# Altium project DT10965_MOTOR_CONTROLLER.PrjPcb (part 2 of 6)

## Sheet Flash_memory.SchDoc: =DT_SCH_Title
size A3; Organization: Droid Technologies; DocumentNumber: DT10965; Revision: 1.0; SheetNumber: 5; SheetTotal: 18
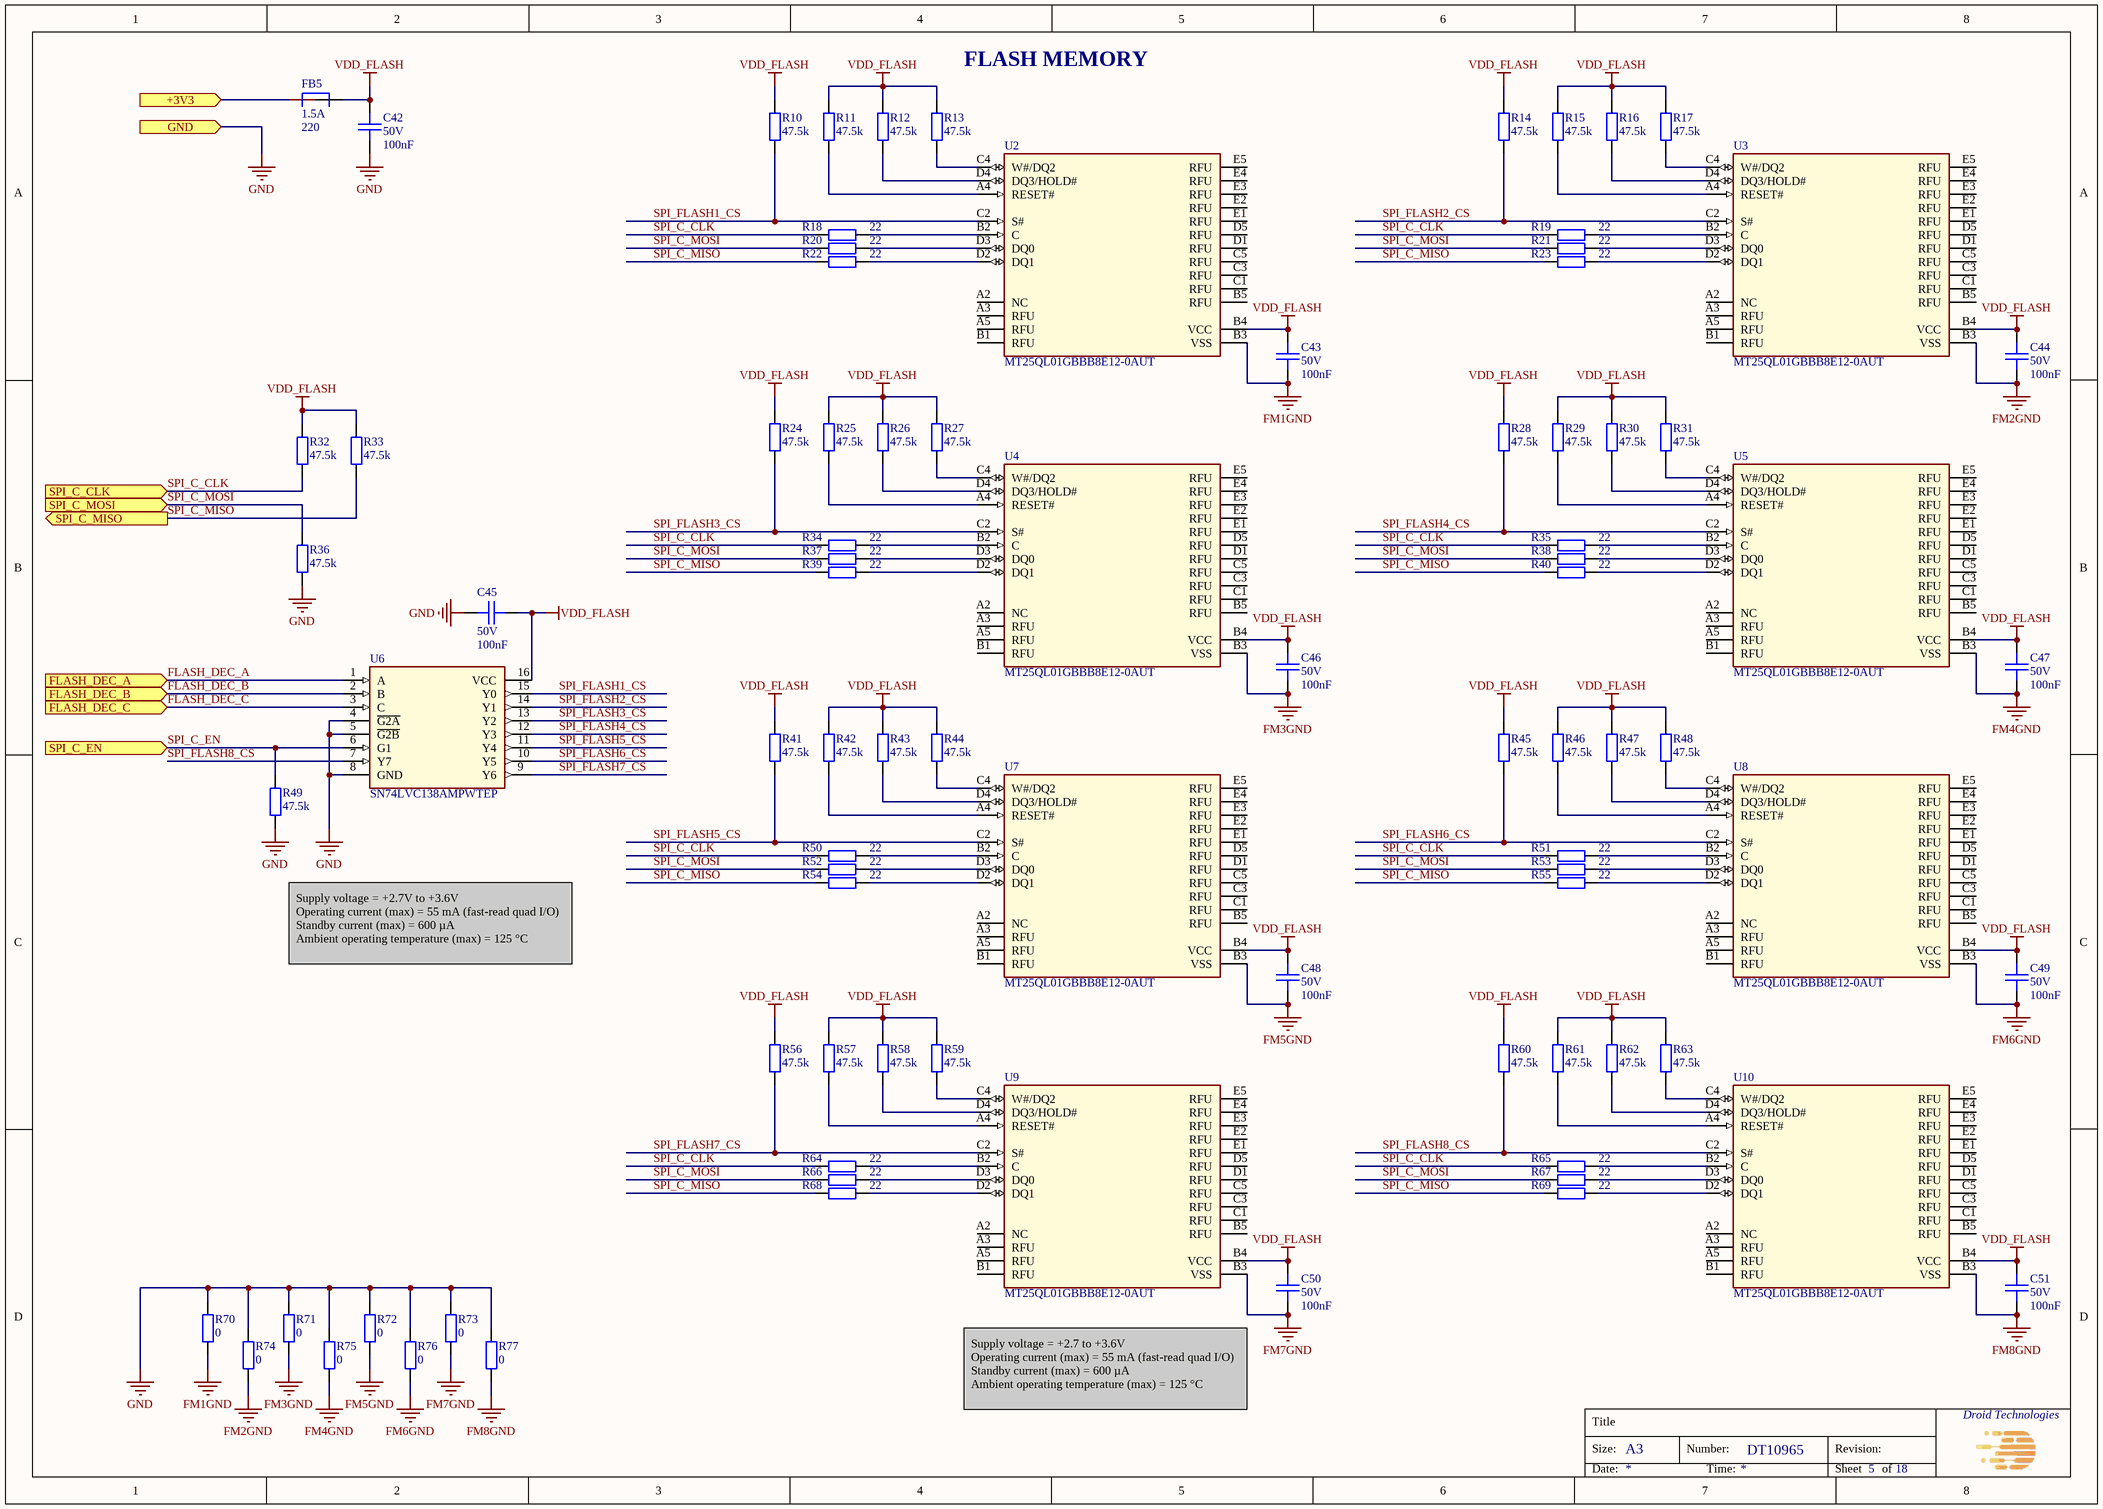
[diagram p4: Flash_memory.SchDoc]

### Parts
C42  Voltage Rating: 50V  Capacitance: 100nF  [CAPC100x50x50L25]  (hidden comment: GCM155L8EH104KE07D)
C43  Voltage Rating: 50V  Capacitance: 100nF  [CAPC100x50x50L25]  (hidden comment: GCM155L8EH104KE07D)
C44  Voltage Rating: 50V  Capacitance: 100nF  [CAPC100x50x50L25]  (hidden comment: GCM155L8EH104KE07D)
C45  Voltage Rating: 50V  Capacitance: 100nF  [CAPC100x50x50L25]  (hidden comment: GCM155L8EH104KE07D)
C46  Voltage Rating: 50V  Capacitance: 100nF  [CAPC100x50x50L25]  (hidden comment: GCM155L8EH104KE07D)
C47  Voltage Rating: 50V  Capacitance: 100nF  [CAPC100x50x50L25]  (hidden comment: GCM155L8EH104KE07D)
C48  Voltage Rating: 50V  Capacitance: 100nF  [CAPC100x50x50L25]  (hidden comment: GCM155L8EH104KE07D)
C49  Voltage Rating: 50V  Capacitance: 100nF  [CAPC100x50x50L25]  (hidden comment: GCM155L8EH104KE07D)
C50  Voltage Rating: 50V  Capacitance: 100nF  [CAPC100x50x50L25]  (hidden comment: GCM155L8EH104KE07D)
C51  Voltage Rating: 50V  Capacitance: 100nF  [CAPC100x50x50L25]  (hidden comment: GCM155L8EH104KE07D)
FB5  Imax: 1.5A  Impedance: 220  [BEADC160X80X95L40]  (hidden comment: BLM18KG221BH1D)
R10  Resistance: 47.5k  [RESC100X50X40L25]  (hidden comment: RC0402FR-0747K5L)
R11  Resistance: 47.5k  [RESC100X50X40L25]  (hidden comment: RC0402FR-0747K5L)
R12  Resistance: 47.5k  [RESC100X50X40L25]  (hidden comment: RC0402FR-0747K5L)
R13  Resistance: 47.5k  [RESC100X50X40L25]  (hidden comment: RC0402FR-0747K5L)
R14  Resistance: 47.5k  [RESC100X50X40L25]  (hidden comment: RC0402FR-0747K5L)
R15  Resistance: 47.5k  [RESC100X50X40L25]  (hidden comment: RC0402FR-0747K5L)
R16  Resistance: 47.5k  [RESC100X50X40L25]  (hidden comment: RC0402FR-0747K5L)
R17  Resistance: 47.5k  [RESC100X50X40L25]  (hidden comment: RC0402FR-0747K5L)
R18  Resistance: 22  [RESC100X50X40L25]  (hidden comment: RC0402FR-0722RL)
R19  Resistance: 22  [RESC100X50X40L25]  (hidden comment: RC0402FR-0722RL)
R20  Resistance: 22  [RESC100X50X40L25]  (hidden comment: RC0402FR-0722RL)
R21  Resistance: 22  [RESC100X50X40L25]  (hidden comment: RC0402FR-0722RL)
R22  Resistance: 22  [RESC100X50X40L25]  (hidden comment: RC0402FR-0722RL)
R23  Resistance: 22  [RESC100X50X40L25]  (hidden comment: RC0402FR-0722RL)
R24  Resistance: 47.5k  [RESC100X50X40L25]  (hidden comment: RC0402FR-0747K5L)
R25  Resistance: 47.5k  [RESC100X50X40L25]  (hidden comment: RC0402FR-0747K5L)
R26  Resistance: 47.5k  [RESC100X50X40L25]  (hidden comment: RC0402FR-0747K5L)
R27  Resistance: 47.5k  [RESC100X50X40L25]  (hidden comment: RC0402FR-0747K5L)
R28  Resistance: 47.5k  [RESC100X50X40L25]  (hidden comment: RC0402FR-0747K5L)
R29  Resistance: 47.5k  [RESC100X50X40L25]  (hidden comment: RC0402FR-0747K5L)
R30  Resistance: 47.5k  [RESC100X50X40L25]  (hidden comment: RC0402FR-0747K5L)
R31  Resistance: 47.5k  [RESC100X50X40L25]  (hidden comment: RC0402FR-0747K5L)
R32  Resistance: 47.5k  [RESC100X50X40L25]  (hidden comment: RC0402FR-0747K5L)
R33  Resistance: 47.5k  [RESC100X50X40L25]  (hidden comment: RC0402FR-0747K5L)
R34  Resistance: 22  [RESC100X50X40L25]  (hidden comment: RC0402FR-0722RL)
R35  Resistance: 22  [RESC100X50X40L25]  (hidden comment: RC0402FR-0722RL)
R36  Resistance: 47.5k  [RESC100X50X40L25]  (hidden comment: RC0402FR-0747K5L)
R37  Resistance: 22  [RESC100X50X40L25]  (hidden comment: RC0402FR-0722RL)
R38  Resistance: 22  [RESC100X50X40L25]  (hidden comment: RC0402FR-0722RL)
R39  Resistance: 22  [RESC100X50X40L25]  (hidden comment: RC0402FR-0722RL)
R40  Resistance: 22  [RESC100X50X40L25]  (hidden comment: RC0402FR-0722RL)
R41  Resistance: 47.5k  [RESC100X50X40L25]  (hidden comment: RC0402FR-0747K5L)
R42  Resistance: 47.5k  [RESC100X50X40L25]  (hidden comment: RC0402FR-0747K5L)
R43  Resistance: 47.5k  [RESC100X50X40L25]  (hidden comment: RC0402FR-0747K5L)
R44  Resistance: 47.5k  [RESC100X50X40L25]  (hidden comment: RC0402FR-0747K5L)
R45  Resistance: 47.5k  [RESC100X50X40L25]  (hidden comment: RC0402FR-0747K5L)
R46  Resistance: 47.5k  [RESC100X50X40L25]  (hidden comment: RC0402FR-0747K5L)
R47  Resistance: 47.5k  [RESC100X50X40L25]  (hidden comment: RC0402FR-0747K5L)
R48  Resistance: 47.5k  [RESC100X50X40L25]  (hidden comment: RC0402FR-0747K5L)
R49  Resistance: 47.5k  [RESC100X50X40L25]  (hidden comment: RC0402FR-0747K5L)
R50  Resistance: 22  [RESC100X50X40L25]  (hidden comment: RC0402FR-0722RL)
R51  Resistance: 22  [RESC100X50X40L25]  (hidden comment: RC0402FR-0722RL)
R52  Resistance: 22  [RESC100X50X40L25]  (hidden comment: RC0402FR-0722RL)
R53  Resistance: 22  [RESC100X50X40L25]  (hidden comment: RC0402FR-0722RL)
R54  Resistance: 22  [RESC100X50X40L25]  (hidden comment: RC0402FR-0722RL)
R55  Resistance: 22  [RESC100X50X40L25]  (hidden comment: RC0402FR-0722RL)
R56  Resistance: 47.5k  [RESC100X50X40L25]  (hidden comment: RC0402FR-0747K5L)
R57  Resistance: 47.5k  [RESC100X50X40L25]  (hidden comment: RC0402FR-0747K5L)
R58  Resistance: 47.5k  [RESC100X50X40L25]  (hidden comment: RC0402FR-0747K5L)
R59  Resistance: 47.5k  [RESC100X50X40L25]  (hidden comment: RC0402FR-0747K5L)
R60  Resistance: 47.5k  [RESC100X50X40L25]  (hidden comment: RC0402FR-0747K5L)
R61  Resistance: 47.5k  [RESC100X50X40L25]  (hidden comment: RC0402FR-0747K5L)
R62  Resistance: 47.5k  [RESC100X50X40L25]  (hidden comment: RC0402FR-0747K5L)
R63  Resistance: 47.5k  [RESC100X50X40L25]  (hidden comment: RC0402FR-0747K5L)
R64  Resistance: 22  [RESC100X50X40L25]  (hidden comment: RC0402FR-0722RL)
R65  Resistance: 22  [RESC100X50X40L25]  (hidden comment: RC0402FR-0722RL)
R66  Resistance: 22  [RESC100X50X40L25]  (hidden comment: RC0402FR-0722RL)
R67  Resistance: 22  [RESC100X50X40L25]  (hidden comment: RC0402FR-0722RL)
R68  Resistance: 22  [RESC100X50X40L25]  (hidden comment: RC0402FR-0722RL)
R69  Resistance: 22  [RESC100X50X40L25]  (hidden comment: RC0402FR-0722RL)
R70  Resistance: 0  [RESC160X80X55L30]  (hidden comment: RC0603FR-070RL)
R71  Resistance: 0  [RESC160X80X55L30]  (hidden comment: RC0603FR-070RL)
R72  Resistance: 0  [RESC160X80X55L30]  (hidden comment: RC0603FR-070RL)
R73  Resistance: 0  [RESC160X80X55L30]  (hidden comment: RC0603FR-070RL)
R74  Resistance: 0  [RESC160X80X55L30]  (hidden comment: RC0603FR-070RL)
R75  Resistance: 0  [RESC160X80X55L30]  (hidden comment: RC0603FR-070RL)
R76  Resistance: 0  [RESC160X80X55L30]  (hidden comment: RC0603FR-070RL)
R77  Resistance: 0  [RESC160X80X55L30]  (hidden comment: RC0603FR-070RL)
U2  MT25QL01GBBB8E12-0AUT  [24-T-PBGA (6x8)]
U3  MT25QL01GBBB8E12-0AUT  [24-T-PBGA (6x8)]
U4  MT25QL01GBBB8E12-0AUT  [24-T-PBGA (6x8)]
U5  MT25QL01GBBB8E12-0AUT  [24-T-PBGA (6x8)]
U6  SN74LVC138AMPWTEP  [TSSOP16]
U7  MT25QL01GBBB8E12-0AUT  [24-T-PBGA (6x8)]
U8  MT25QL01GBBB8E12-0AUT  [24-T-PBGA (6x8)]
U9  MT25QL01GBBB8E12-0AUT  [24-T-PBGA (6x8)]
U10  MT25QL01GBBB8E12-0AUT  [24-T-PBGA (6x8)]

### Ports
+3V3 (in), FLASH_DEC_A (in), FLASH_DEC_B (in), FLASH_DEC_C (in), GND (in), SPI_C_CLK (in), SPI_C_EN (in), SPI_C_MISO (out), SPI_C_MOSI (in)

### Nets
+3V3: FB5.1 ; port +3V3
FM1GND: C43.1 R70.1 U2.B3(VSS)
FM2GND: C44.1 R74.1 U3.B3(VSS)
FM3GND: C46.1 R71.1 U4.B3(VSS)
FM4GND: C47.1 R75.1 U5.B3(VSS)
FM5GND: C48.1 R72.1 U7.B3(VSS)
FM6GND: C49.1 R76.1 U8.B3(VSS)
FM7GND: C50.1 R73.1 U9.B3(VSS)
FM8GND: C51.1 R77.1 U10.B3(VSS)
GND: C42.1 C45.1 R36.1 R49.1 R70.2 R71.2 R72.2 R73.2 R74.2 R75.2 R76.2 R77.2 U6.4(~{G2A}) U6.5(~{G2B}) U6.8(GND) ; port GND
VDD_FLASH: C42.2 C43.2 C44.2 C45.2 C46.2 C47.2 C48.2 C49.2 C50.2 C51.2 FB5.2 R10.2 R11.2 R12.2 R13.2 R14.2 R15.2 R16.2 R17.2 R24.2 R25.2 R26.2 R27.2 R28.2 R29.2 R30.2 R31.2 R32.2 R33.2 R41.2 R42.2 R43.2 R44.2 R45.2 R46.2 R47.2 R48.2 R56.2 R57.2 R58.2 R59.2 R60.2 R61.2 R62.2 R63.2 U2.B4(VCC) U3.B4(VCC) U4.B4(VCC) U5.B4(VCC) U6.16(VCC) U7.B4(VCC) U8.B4(VCC) U9.B4(VCC) U10.B4(VCC)
FLASH_DEC_A: U6.1(A) ; port FLASH_DEC_A
FLASH_DEC_B: U6.2(B) ; port FLASH_DEC_B
FLASH_DEC_C: U6.3(C) ; port FLASH_DEC_C
SPI_C_CLK: R18.1 R19.1 R32.1 R34.1 R35.1 R50.1 R51.1 R64.1 R65.1 ; port SPI_C_CLK
SPI_C_EN: R49.2 U6.6(G1) ; port SPI_C_EN
SPI_C_MISO: R22.1 R23.1 R33.1 R39.1 R40.1 R54.1 R55.1 R68.1 R69.1 ; port SPI_C_MISO
SPI_C_MOSI: R20.1 R21.1 R36.2 R37.1 R38.1 R52.1 R53.1 R66.1 R67.1 ; port SPI_C_MOSI
SPI_FLASH1_CS: R10.1 U2.C2(S#) U6.15(Y0)
SPI_FLASH2_CS: R14.1 U3.C2(S#) U6.14(Y1)
SPI_FLASH3_CS: R24.1 U4.C2(S#) U6.13(Y2)
SPI_FLASH4_CS: R28.1 U5.C2(S#) U6.12(Y3)
SPI_FLASH5_CS: R41.1 U6.11(Y4) U7.C2(S#)
SPI_FLASH6_CS: R45.1 U6.10(Y5) U8.C2(S#)
SPI_FLASH7_CS: R56.1 U6.9(Y6) U9.C2(S#)
SPI_FLASH8_CS: R60.1 U6.7(Y7) U10.C2(S#)
NetR11_1: R11.1 U2.A4(RESET#)
NetR12_1: R12.1 U2.D4(DQ3/HOLD#)
NetR13_1: R13.1 U2.C4(W#/DQ2)
NetR15_1: R15.1 U3.A4(RESET#)
NetR16_1: R16.1 U3.D4(DQ3/HOLD#)
NetR17_1: R17.1 U3.C4(W#/DQ2)
NetR18_2: R18.2 U2.B2(C)
NetR19_2: R19.2 U3.B2(C)
NetR20_2: R20.2 U2.D3(DQ0)
NetR21_2: R21.2 U3.D3(DQ0)
NetR22_2: R22.2 U2.D2(DQ1)
NetR23_2: R23.2 U3.D2(DQ1)
NetR25_1: R25.1 U4.A4(RESET#)
NetR26_1: R26.1 U4.D4(DQ3/HOLD#)
NetR27_1: R27.1 U4.C4(W#/DQ2)
NetR29_1: R29.1 U5.A4(RESET#)
NetR30_1: R30.1 U5.D4(DQ3/HOLD#)
NetR31_1: R31.1 U5.C4(W#/DQ2)
NetR34_2: R34.2 U4.B2(C)
NetR35_2: R35.2 U5.B2(C)
NetR37_2: R37.2 U4.D3(DQ0)
NetR38_2: R38.2 U5.D3(DQ0)
NetR39_2: R39.2 U4.D2(DQ1)
NetR40_2: R40.2 U5.D2(DQ1)
NetR42_1: R42.1 U7.A4(RESET#)
NetR43_1: R43.1 U7.D4(DQ3/HOLD#)
NetR44_1: R44.1 U7.C4(W#/DQ2)
NetR46_1: R46.1 U8.A4(RESET#)
NetR47_1: R47.1 U8.D4(DQ3/HOLD#)
NetR48_1: R48.1 U8.C4(W#/DQ2)
NetR50_2: R50.2 U7.B2(C)
NetR51_2: R51.2 U8.B2(C)
NetR52_2: R52.2 U7.D3(DQ0)
NetR53_2: R53.2 U8.D3(DQ0)
NetR54_2: R54.2 U7.D2(DQ1)
NetR55_2: R55.2 U8.D2(DQ1)
NetR57_1: R57.1 U9.A4(RESET#)
NetR58_1: R58.1 U9.D4(DQ3/HOLD#)
NetR59_1: R59.1 U9.C4(W#/DQ2)
NetR61_1: R61.1 U10.A4(RESET#)
NetR62_1: R62.1 U10.D4(DQ3/HOLD#)
NetR63_1: R63.1 U10.C4(W#/DQ2)
NetR64_2: R64.2 U9.B2(C)
NetR65_2: R65.2 U10.B2(C)
NetR66_2: R66.2 U9.D3(DQ0)
NetR67_2: R67.2 U10.D3(DQ0)
NetR68_2: R68.2 U9.D2(DQ1)
NetR69_2: R69.2 U10.D2(DQ1)

Not connected (* = marked no-connect by the designer): U2 A2(NC) A3(RFU) A5(RFU) B1(RFU) B5(RFU) C1(RFU) C3(RFU) C5(RFU) D1(RFU) D5(RFU) E1(RFU) E2(RFU) E3(RFU) E4(RFU) E5(RFU); U3 A2(NC) A3(RFU) A5(RFU) B1(RFU) B5(RFU) C1(RFU) C3(RFU) C5(RFU) D1(RFU) D5(RFU) E1(RFU) E2(RFU) E3(RFU) E4(RFU) E5(RFU); U4 A2(NC) A3(RFU) A5(RFU) B1(RFU) B5(RFU) C1(RFU) C3(RFU) C5(RFU) D1(RFU) D5(RFU) E1(RFU) E2(RFU) E3(RFU) E4(RFU) E5(RFU); U5 A2(NC) A3(RFU) A5(RFU) B1(RFU) B5(RFU) C1(RFU) C3(RFU) C5(RFU) D1(RFU) D5(RFU) E1(RFU) E2(RFU) E3(RFU) E4(RFU) E5(RFU); U7 A2(NC) A3(RFU) A5(RFU) B1(RFU) B5(RFU) C1(RFU) C3(RFU) C5(RFU) D1(RFU) D5(RFU) E1(RFU) E2(RFU) E3(RFU) E4(RFU) E5(RFU); U8 A2(NC) A3(RFU) A5(RFU) B1(RFU) B5(RFU) C1(RFU) C3(RFU) C5(RFU) D1(RFU) D5(RFU) E1(RFU) E2(RFU) E3(RFU) E4(RFU) E5(RFU); U9 A2(NC) A3(RFU) A5(RFU) B1(RFU) B5(RFU) C1(RFU) C3(RFU) C5(RFU) D1(RFU) D5(RFU) E1(RFU) E2(RFU) E3(RFU) E4(RFU) E5(RFU); U10 A2(NC) A3(RFU) A5(RFU) B1(RFU) B5(RFU) C1(RFU) C3(RFU) C5(RFU) D1(RFU) D5(RFU) E1(RFU) E2(RFU) E3(RFU) E4(RFU) E5(RFU)

### Notes on the sheet
- (near R13) FLASH MEMORY
- Supply voltage = +2.7V to +3.6V
  Operating current (max) = 55 mA (fast-read quad I/O)
  Standby current (max) = 600 µA
  Ambient operating temperature (max) = 125 °C
- Supply voltage = +2.7 to +3.6V
  Operating current (max) = 55 mA (fast-read quad I/O)
  Standby current (max) = 600 µA
  Ambient operating temperature (max) = 125 °C
- Title
- Size:
- A3
- Number:
- Revision:
- Date:
- Time:
- Sheet
- of

### Library data of the parts
C42-C51 = CMP-001-1980-2: as C3 on sheet MCU; Height max: 550µm; ComponentLink3Description: Digikey; Mounting Type: SM; ComponentLink3URL: https://www.digikey.com/en/products/detail/murata-electronics/GCM155L8EH104KE07D/11618823; Package: 0402 (1005 Metric); Lead Spacing: 0mm; MPN: GCM155L8EH104KE07D; Size: 1.00mm x 0.50mm; Ratings: AEC-Q200; ComponentLink1URL: https://www.murata.com/en-us/products/productdetail?partno=GCM155L8EH104KE07%23; ComponentLink1Description: Datasheet; Dielectric: X8L; ComponentLink2Description: Mouser; ComponentLink2URL: https://eu.mouser.com/ProductDetail/Murata-Electronics/GCM155L8EH104KE07D?qs=1mbolxNpo8fQSHf0HYnZWw%3D%3D
FB5 = CMP-001-1981-1: as FB1 on sheet MCU; Mounting Type: SM; Size: 1.60mm x 0.80mm; ComponentLink2URL: https://eu.mouser.com/ProductDetail/Murata-Electronics/BLM18KG221BH1D?qs=sJ5gq5MLFXpgEHYBdWUtkQ%3D%3D; ComponentLink1Description: Datasheet; ComponentLink1URL: https://www.murata.com/en-us/products/productdata/8798137286686/QNFA9129.pdf; Lead Spacing: 0mm; Ratings: AEC-Q200; ComponentLink3Description: Digikey; ComponentLink3URL: https://www.digikey.com/en/products/detail/murata-electronics/BLM18KG221BH1D/6156000; Height max: 950µm; Package: 0603 (1608 Metric); ComponentLink2Description: Mouser; MPN: BLM18KG221BH1D
R10-R17 R24-R33 R36 R41-R49 R56-R63 = CMP-001-0277-7: RES 47.5K OHM 1% 1/16W 0402; Manufacturer: YAGEO; Op Temp min: -55°C; Power: 63mW; Temperature Coefficient: ±100ppm; Op Temp max: 155°C; ComponentLink1URL: https://www.yageo.com/upload/media/product/productsearch/datasheet/rchip/PYu-RC_Group_51_RoHS_L_12.pdf; ComponentLink1Description: Datasheet; MPN: RC0402FR-0747K5L; ComponentLink3Description: Digikey; ComponentLink2URL: https://eu.mouser.com/ProductDetail/YAGEO/RC0402FR-0747K5L?qs=V1yeUXFNrklfu86Rfgihxg%3D%3D; Mounting Type: SM; Tolerance: 1%; Package: 0402 (1005 Metric); Height max: 400µm; ComponentLink2Description: Mouser; ComponentLink3URL: https://www.digikey.com/en/products/detail/yageo/RC0402FR-0747K5L/726617; Size: 1.00mm x 0.50mm; Composition: Thick Film; Ratings: -
R18-R23 R34 R35 R37-R40 R50-R55 R64-R69 = CMP-001-0482-4: as R3 on sheet MCU; Ratings: -; ComponentLink3URL: https://www.digikey.com/en/products/detail/yageo/RC0402FR-0722RL/726562; ComponentLink2URL: https://eu.mouser.com/ProductDetail/YAGEO/RC0402FR-0722RL?qs=V1yeUXFNrkkRg6zf08ADKQ%3D%3D; MPN: RC0402FR-0722RL; ComponentLink1Description: Datasheet; ComponentLink3Description: Digikey; Tolerance: 1%; Size: 1.00mm x 0.50mm; ComponentLink1URL: https://www.yageo.com/upload/media/product/productsearch/datasheet/rchip/PYu-RC_Group_51_RoHS_L_12.pdf; Composition: Thick Film; ComponentLink2Description: Mouser; Mounting Type: SM; Package: 0402 (1005 Metric); Height max: 400µm
R70-R77 = CMP-001-0927-2: as R240 on sheet MCU; Height max: 550µm; ComponentLink2URL: https://eu.mouser.com/ProductDetail/YAGEO/RC0603FR-070RL?qs=0yPvnVz5%2FmpDQv43TwvCfw%3D%3D; Temperature Coefficient: -; ComponentLink3Description: Digikey; ComponentLink2Description: Mouser; MPN: RC0603FR-070RL; ComponentLink1URL: https://www.yageo.com/upload/media/product/productsearch/datasheet/rchip/PYu-RC_Group_51_RoHS_L_12.pdf; Ratings: -; Size: 1.60mm x 0.80mm; Composition: Thick Film; Mounting Type: SM; ComponentLink3URL: https://www.digikey.com/en/products/detail/yageo/RC0603FR-070RL/1304008; Package: 0603 (1608 Metric); ComponentLink1Description: Datasheet
U2-U5 U7-U10 = MT25QL01GBBB8E12-0AUT: IC FLASH 1GBIT SPI 24TPBGA; Manufacturer: Micron Technology Inc.; MPN: MT25QL01GBBB8E12-0AUT
U6 = SN74LVC138AMPWTEP: IC DECODER/DEMUX 1X3:8 16-TSSOP; Manufacturer: Texas Instruments; MPN: SN74LVC138AMPWTEP

## Sheet EEPROM_memory.SchDoc: =DT_SCH_Title
size A4; Organization: Droid Technologies; DocumentNumber: DT10965; Revision: 1.0; SheetNumber: 6; SheetTotal: 18
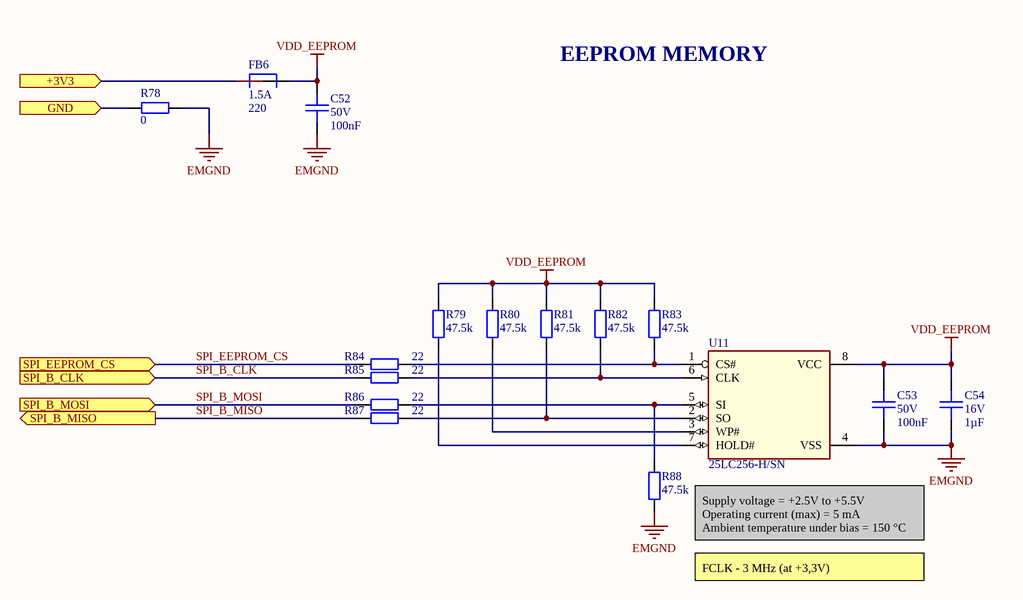
[diagram p5: EEPROM_memory.SchDoc]

### Parts
C52  Voltage Rating: 50V  Capacitance: 100nF  [CAPC100x50x50L25]  (hidden comment: GCM155L8EH104KE07D)
C53  Voltage Rating: 50V  Capacitance: 100nF  [CAPC100x50x50L25]  (hidden comment: GCM155L8EH104KE07D)
C54  Voltage Rating: 16V  Capacitance: 1µF  [CAPC160X80X90L35]  (hidden comment: GCG188L8EE105KA07D)
FB6  Imax: 1.5A  Impedance: 220  [BEADC160X80X95L40]  (hidden comment: BLM18KG221BH1D)
R78  Resistance: 0  [RESC160X80X55L30]  (hidden comment: RC0603FR-070RL)
R79  Resistance: 47.5k  [RESC100X50X40L25]  (hidden comment: RC0402FR-0747K5L)
R80  Resistance: 47.5k  [RESC100X50X40L25]  (hidden comment: RC0402FR-0747K5L)
R81  Resistance: 47.5k  [RESC100X50X40L25]  (hidden comment: RC0402FR-0747K5L)
R82  Resistance: 47.5k  [RESC100X50X40L25]  (hidden comment: RC0402FR-0747K5L)
R83  Resistance: 47.5k  [RESC100X50X40L25]  (hidden comment: RC0402FR-0747K5L)
R84  Resistance: 22  [RESC100X50X40L25]  (hidden comment: RC0402FR-0722RL)
R85  Resistance: 22  [RESC100X50X40L25]  (hidden comment: RC0402FR-0722RL)
R86  Resistance: 22  [RESC100X50X40L25]  (hidden comment: RC0402FR-0722RL)
R87  Resistance: 22  [RESC100X50X40L25]  (hidden comment: RC0402FR-0722RL)
R88  Resistance: 47.5k  [RESC100X50X40L25]  (hidden comment: RC0402FR-0747K5L)
U11  25LC256-H/SN  [SOIC8P127_490X600X175L70X41]

### Ports
+3V3 (in), GND (in), SPI_B_CLK (in), SPI_B_MISO (out), SPI_B_MOSI (in), SPI_EEPROM_CS (in)

### Nets
+3V3: FB6.1 ; port +3V3
EMGND: C52.1 C53.1 C54.1 R78.1 R88.1 U11.4(VSS)
GND: R78.2 ; port GND
VDD_EEPROM: C52.2 C53.2 C54.2 FB6.2 R79.2 R80.2 R81.2 R82.2 R83.2 U11.8(VCC)
SPI_B_CLK: R85.1 ; port SPI_B_CLK
SPI_B_MISO: R87.1 ; port SPI_B_MISO
SPI_B_MOSI: R86.1 ; port SPI_B_MOSI
SPI_EEPROM_CS: R84.1 ; port SPI_EEPROM_CS
NetR79_1: R79.1 U11.7(HOLD#)
NetR80_1: R80.1 U11.3(WP#)
NetR81_1: R81.1 R87.2 U11.2(SO)
NetR82_1: R82.1 R85.2 U11.6(CLK)
NetR83_1: R83.1 R84.2 U11.1(CS#)
NetR86_2: R86.2 R88.2 U11.5(SI)

### Notes on the sheet
- EEPROM MEMORY
- Supply voltage = +2.5V to +5.5V
  Operating current (max) = 5 mA
  Ambient temperature under bias = 150 °C
- FCLK - 3 MHz (at +3,3V)
- Title
- Size:
- A4
- Number:
- Revision:
- Date:
- Time:
- Sheet
- of

### Library data of the parts
C52 C53 = CMP-001-1980-2: as C3 on sheet MCU; Height max: 550µm; ComponentLink3Description: Digikey; Mounting Type: SM; ComponentLink3URL: https://www.digikey.com/en/products/detail/murata-electronics/GCM155L8EH104KE07D/11618823; Package: 0402 (1005 Metric); Lead Spacing: 0mm; MPN: GCM155L8EH104KE07D; Size: 1.00mm x 0.50mm; Ratings: AEC-Q200; ComponentLink1URL: https://www.murata.com/en-us/products/productdetail?partno=GCM155L8EH104KE07%23; ComponentLink1Description: Datasheet; Dielectric: X8L; ComponentLink2Description: Mouser; ComponentLink2URL: https://eu.mouser.com/ProductDetail/Murata-Electronics/GCM155L8EH104KE07D?qs=1mbolxNpo8fQSHf0HYnZWw%3D%3D
C54 = CMP-001-1982-2: CAP CER 1UF 16V X8L 0603; Manufacturer: Murata Electronics; Tolerance: 10%; Op Temp min: -55°C; Op Temp max: 150°C; ComponentLink3URL: https://www.digikey.com/en/products/detail/murata-electronics/GCG188L8EE105KA07D/10695125; Package: 0603 (1608 Metric); MPN: GCG188L8EE105KA07D; ComponentLink2URL: https://eu.mouser.com/ProductDetail/Murata-Electronics/GCG188L8EE105KA07D?qs=rrS6PyfT74dFMfTR80dVTA%3D%3D; Dielectric: X8L; Size: 1.60mm x 0.80mm; ComponentLink1Description: Datasheet; ComponentLink1URL: https://www.murata.com/en-us/products/productdetail?partno=GCG188L8EE105KA07%23; ComponentLink2Description: Mouser; Height max: 900µm; Mounting Type: SM; ComponentLink3Description: Digikey; Lead Spacing: 0mm; Ratings: AEC-Q200
FB6 = CMP-001-1981-1: as FB1 on sheet MCU; Mounting Type: SM; Size: 1.60mm x 0.80mm; ComponentLink2URL: https://eu.mouser.com/ProductDetail/Murata-Electronics/BLM18KG221BH1D?qs=sJ5gq5MLFXpgEHYBdWUtkQ%3D%3D; ComponentLink1Description: Datasheet; ComponentLink1URL: https://www.murata.com/en-us/products/productdata/8798137286686/QNFA9129.pdf; Lead Spacing: 0mm; Ratings: AEC-Q200; ComponentLink3Description: Digikey; ComponentLink3URL: https://www.digikey.com/en/products/detail/murata-electronics/BLM18KG221BH1D/6156000; Height max: 950µm; Package: 0603 (1608 Metric); ComponentLink2Description: Mouser; MPN: BLM18KG221BH1D
R78 = CMP-001-0927-2: as R240 on sheet MCU; Height max: 550µm; ComponentLink2URL: https://eu.mouser.com/ProductDetail/YAGEO/RC0603FR-070RL?qs=0yPvnVz5%2FmpDQv43TwvCfw%3D%3D; Temperature Coefficient: -; ComponentLink3Description: Digikey; ComponentLink2Description: Mouser; MPN: RC0603FR-070RL; ComponentLink1URL: https://www.yageo.com/upload/media/product/productsearch/datasheet/rchip/PYu-RC_Group_51_RoHS_L_12.pdf; Ratings: -; Size: 1.60mm x 0.80mm; Composition: Thick Film; Mounting Type: SM; ComponentLink3URL: https://www.digikey.com/en/products/detail/yageo/RC0603FR-070RL/1304008; Package: 0603 (1608 Metric); ComponentLink1Description: Datasheet
R79-R83 R88 = CMP-001-0277-7: as R10 on sheet Flash_memory; ComponentLink1URL: https://www.yageo.com/upload/media/product/productsearch/datasheet/rchip/PYu-RC_Group_51_RoHS_L_12.pdf; ComponentLink1Description: Datasheet; MPN: RC0402FR-0747K5L; ComponentLink3Description: Digikey; ComponentLink2URL: https://eu.mouser.com/ProductDetail/YAGEO/RC0402FR-0747K5L?qs=V1yeUXFNrklfu86Rfgihxg%3D%3D; Mounting Type: SM; Tolerance: 1%; Package: 0402 (1005 Metric); Height max: 400µm; ComponentLink2Description: Mouser; ComponentLink3URL: https://www.digikey.com/en/products/detail/yageo/RC0402FR-0747K5L/726617; Size: 1.00mm x 0.50mm; Composition: Thick Film; Ratings: -
R84-R87 = CMP-001-0482-4: as R3 on sheet MCU; Ratings: -; ComponentLink3URL: https://www.digikey.com/en/products/detail/yageo/RC0402FR-0722RL/726562; ComponentLink2URL: https://eu.mouser.com/ProductDetail/YAGEO/RC0402FR-0722RL?qs=V1yeUXFNrkkRg6zf08ADKQ%3D%3D; MPN: RC0402FR-0722RL; ComponentLink1Description: Datasheet; ComponentLink3Description: Digikey; Tolerance: 1%; Size: 1.00mm x 0.50mm; ComponentLink1URL: https://www.yageo.com/upload/media/product/productsearch/datasheet/rchip/PYu-RC_Group_51_RoHS_L_12.pdf; Composition: Thick Film; ComponentLink2Description: Mouser; Mounting Type: SM; Package: 0402 (1005 Metric); Height max: 400µm
U11 = 25LC256-H/SN: IC EEPROM 256KBIT SPI 5MHZ 8SOIC; Manufacturer: Microchip Technology; MPN: 25LC256-H/SN

## Sheet Temp_sensor.SchDoc: =DT_SCH_Title
size A4; Organization: Droid Technologies; DocumentNumber: DT10965; Revision: 1.0; SheetNumber: 7; SheetTotal: 18
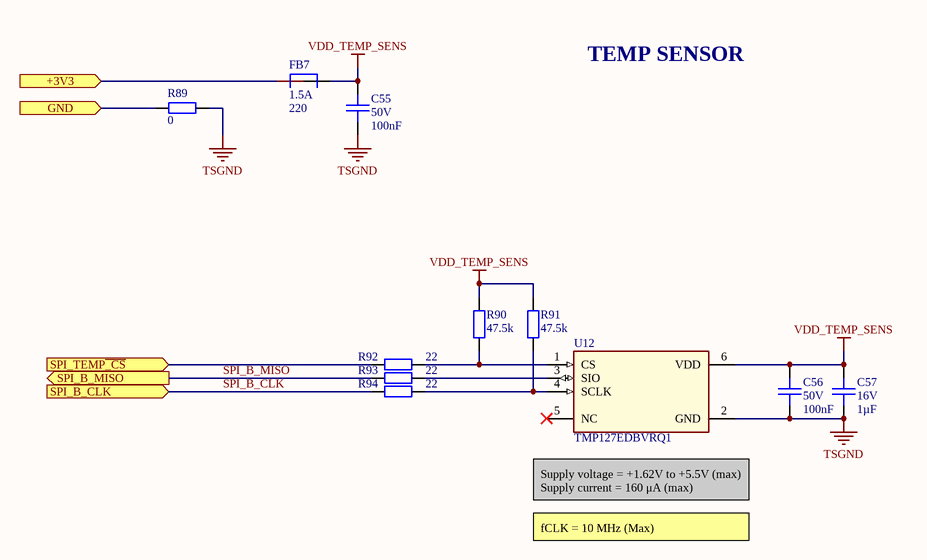
[diagram p6: Temp_sensor.SchDoc]

### Parts
C55  Voltage Rating: 50V  Capacitance: 100nF  [CAPC100x50x50L25]  (hidden comment: GCM155L8EH104KE07D)
C56  Voltage Rating: 50V  Capacitance: 100nF  [CAPC100x50x50L25]  (hidden comment: GCM155L8EH104KE07D)
C57  Voltage Rating: 16V  Capacitance: 1µF  [CAPC160X80X90L35]  (hidden comment: GCG188L8EE105KA07D)
FB7  Imax: 1.5A  Impedance: 220  [BEADC160X80X95L40]  (hidden comment: BLM18KG221BH1D)
R89  Resistance: 0  [RESC160X80X55L30]  (hidden comment: RC0603FR-070RL)
R90  Resistance: 47.5k  [RESC100X50X40L25]  (hidden comment: RC0402FR-0747K5L)
R91  Resistance: 47.5k  [RESC100X50X40L25]  (hidden comment: RC0402FR-0747K5L)
R92  Resistance: 22  [RESC100X50X40L25]  (hidden comment: RC0402FR-0722RL)
R93  Resistance: 22  [RESC100X50X40L25]  (hidden comment: RC0402FR-0722RL)
R94  Resistance: 22  [RESC100X50X40L25]  (hidden comment: RC0402FR-0722RL)
U12  TMP127EDBVRQ1  [SOT-23-6]

### Ports
+3V3 (in), GND (in), SPI_B_CLK (in), SPI_B_MISO (out), SPI_TEMP~{_CS} (in)

### Nets
+3V3: FB7.1 ; port +3V3
GND: R89.2 ; port GND
TSGND: C55.1 C56.1 C57.1 R89.1 U12.2(GND)
VDD_TEMP_SENS: C55.2 C56.2 C57.2 FB7.2 R90.2 R91.2 U12.6(VDD)
SPI_B_CLK: R94.1 ; port SPI_B_CLK
SPI_B_MISO: R93.1 ; port SPI_B_MISO
NetR90_1: R90.1 R92.2 U12.1(CS)
NetR91_1: R91.1 R94.2 U12.4(SCLK)
NetR92_1: R92.1 ; port SPI_TEMP~{_CS}
NetR93_2: R93.2 U12.3(SIO)

Not connected (* = marked no-connect by the designer): U12 5(NC)*

### Notes on the sheet
- TEMP SENSOR
- (near U12) Supply voltage = +1.62V to +5.5V (max)
  Supply current = 160 μA (max)
- fCLK = 10 MHz (Max)
- Title
- Size:
- A4
- Number:
- Revision:
- Date:
- Time:
- Sheet
- of

### Library data of the parts
C55 C56 = CMP-001-1980-2: as C3 on sheet MCU; Height max: 550µm; ComponentLink3Description: Digikey; Mounting Type: SM; ComponentLink3URL: https://www.digikey.com/en/products/detail/murata-electronics/GCM155L8EH104KE07D/11618823; Package: 0402 (1005 Metric); Lead Spacing: 0mm; MPN: GCM155L8EH104KE07D; Size: 1.00mm x 0.50mm; Ratings: AEC-Q200; ComponentLink1URL: https://www.murata.com/en-us/products/productdetail?partno=GCM155L8EH104KE07%23; ComponentLink1Description: Datasheet; Dielectric: X8L; ComponentLink2Description: Mouser; ComponentLink2URL: https://eu.mouser.com/ProductDetail/Murata-Electronics/GCM155L8EH104KE07D?qs=1mbolxNpo8fQSHf0HYnZWw%3D%3D
C57 = CMP-001-1982-2: as C54 on sheet EEPROM_memory; ComponentLink3URL: https://www.digikey.com/en/products/detail/murata-electronics/GCG188L8EE105KA07D/10695125; Package: 0603 (1608 Metric); MPN: GCG188L8EE105KA07D; ComponentLink2URL: https://eu.mouser.com/ProductDetail/Murata-Electronics/GCG188L8EE105KA07D?qs=rrS6PyfT74dFMfTR80dVTA%3D%3D; Dielectric: X8L; Size: 1.60mm x 0.80mm; ComponentLink1Description: Datasheet; ComponentLink1URL: https://www.murata.com/en-us/products/productdetail?partno=GCG188L8EE105KA07%23; ComponentLink2Description: Mouser; Height max: 900µm; Mounting Type: SM; ComponentLink3Description: Digikey; Lead Spacing: 0mm; Ratings: AEC-Q200
FB7 = CMP-001-1981-1: as FB1 on sheet MCU; Mounting Type: SM; Size: 1.60mm x 0.80mm; ComponentLink2URL: https://eu.mouser.com/ProductDetail/Murata-Electronics/BLM18KG221BH1D?qs=sJ5gq5MLFXpgEHYBdWUtkQ%3D%3D; ComponentLink1Description: Datasheet; ComponentLink1URL: https://www.murata.com/en-us/products/productdata/8798137286686/QNFA9129.pdf; Lead Spacing: 0mm; Ratings: AEC-Q200; ComponentLink3Description: Digikey; ComponentLink3URL: https://www.digikey.com/en/products/detail/murata-electronics/BLM18KG221BH1D/6156000; Height max: 950µm; Package: 0603 (1608 Metric); ComponentLink2Description: Mouser; MPN: BLM18KG221BH1D
R89 = CMP-001-0927-2: as R240 on sheet MCU; Height max: 550µm; ComponentLink2URL: https://eu.mouser.com/ProductDetail/YAGEO/RC0603FR-070RL?qs=0yPvnVz5%2FmpDQv43TwvCfw%3D%3D; Temperature Coefficient: -; ComponentLink3Description: Digikey; ComponentLink2Description: Mouser; MPN: RC0603FR-070RL; ComponentLink1URL: https://www.yageo.com/upload/media/product/productsearch/datasheet/rchip/PYu-RC_Group_51_RoHS_L_12.pdf; Ratings: -; Size: 1.60mm x 0.80mm; Composition: Thick Film; Mounting Type: SM; ComponentLink3URL: https://www.digikey.com/en/products/detail/yageo/RC0603FR-070RL/1304008; Package: 0603 (1608 Metric); ComponentLink1Description: Datasheet
R90 R91 = CMP-001-0277-7: as R10 on sheet Flash_memory; ComponentLink1URL: https://www.yageo.com/upload/media/product/productsearch/datasheet/rchip/PYu-RC_Group_51_RoHS_L_12.pdf; ComponentLink1Description: Datasheet; MPN: RC0402FR-0747K5L; ComponentLink3Description: Digikey; ComponentLink2URL: https://eu.mouser.com/ProductDetail/YAGEO/RC0402FR-0747K5L?qs=V1yeUXFNrklfu86Rfgihxg%3D%3D; Mounting Type: SM; Tolerance: 1%; Package: 0402 (1005 Metric); Height max: 400µm; ComponentLink2Description: Mouser; ComponentLink3URL: https://www.digikey.com/en/products/detail/yageo/RC0402FR-0747K5L/726617; Size: 1.00mm x 0.50mm; Composition: Thick Film; Ratings: -
R92-R94 = CMP-001-0482-4: as R3 on sheet MCU; Ratings: -; ComponentLink3URL: https://www.digikey.com/en/products/detail/yageo/RC0402FR-0722RL/726562; ComponentLink2URL: https://eu.mouser.com/ProductDetail/YAGEO/RC0402FR-0722RL?qs=V1yeUXFNrkkRg6zf08ADKQ%3D%3D; MPN: RC0402FR-0722RL; ComponentLink1Description: Datasheet; ComponentLink3Description: Digikey; Tolerance: 1%; Size: 1.00mm x 0.50mm; ComponentLink1URL: https://www.yageo.com/upload/media/product/productsearch/datasheet/rchip/PYu-RC_Group_51_RoHS_L_12.pdf; Composition: Thick Film; ComponentLink2Description: Mouser; Mounting Type: SM; Package: 0402 (1005 Metric); Height max: 400µm
U12 = TMP127EDBVRQ1: AUTOMOTIVE 0.8C SPI TEMPERATURE; Manufacturer: Texas Instruments; MPN: TMP127EDBVRQ1

## Sheet Accelerometers.SchDoc: =DT_SCH_Title
size A4; Organization: Droid Technologies; DocumentNumber: DT10965; Revision: 1.0; SheetNumber: 8; SheetTotal: 18
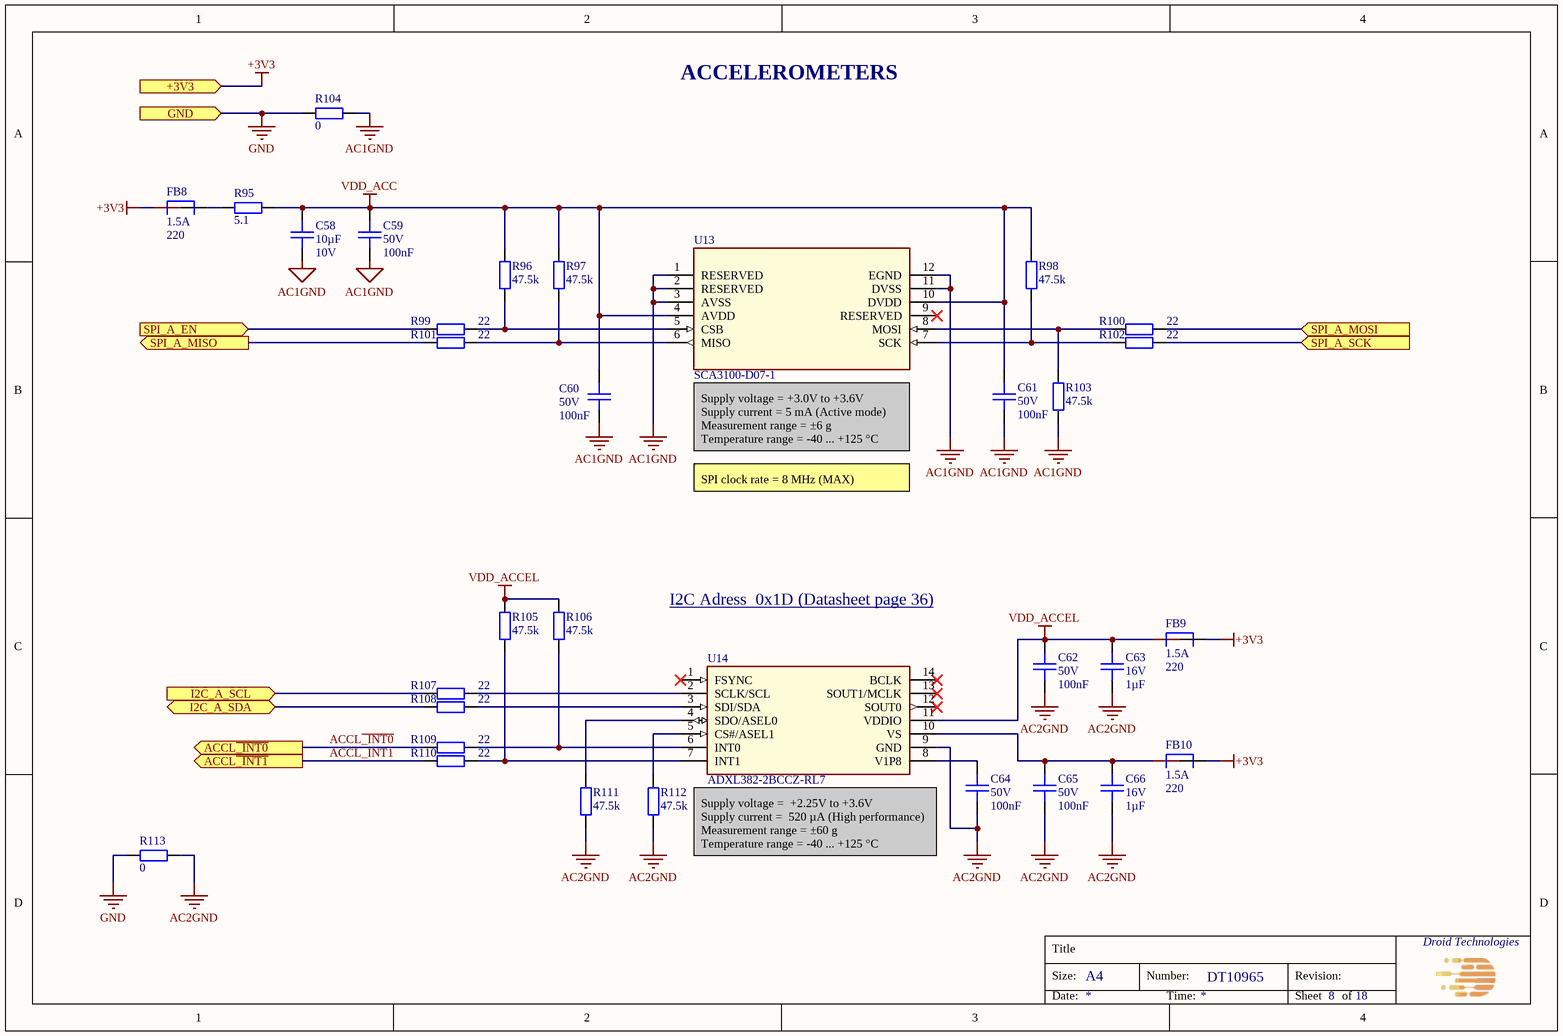
[diagram p7: Accelerometers.SchDoc]

### Parts
C58  Capacitance: 10µF  Voltage Rating: 10V  [CAPC200X125X145L50]  (hidden comment: CGA4J1X8L1A106K125AC)
C59  Voltage Rating: 50V  Capacitance: 100nF  [CAPC100x50x50L25]  (hidden comment: GCM155L8EH104KE07D)
C60  Voltage Rating: 50V  Capacitance: 100nF  [CAPC100x50x50L25]  (hidden comment: GCM155L8EH104KE07D)
C61  Voltage Rating: 50V  Capacitance: 100nF  [CAPC100x50x50L25]  (hidden comment: GCM155L8EH104KE07D)
C62  Voltage Rating: 50V  Capacitance: 100nF  [CAPC100x50x50L25]  (hidden comment: GCM155L8EH104KE07D)
C63  Voltage Rating: 16V  Capacitance: 1µF  [CAPC160X80X90L35]  (hidden comment: GCG188L8EE105KA07D)
C64  Voltage Rating: 50V  Capacitance: 100nF  [CAPC100x50x50L25]  (hidden comment: GCM155L8EH104KE07D)
C65  Voltage Rating: 50V  Capacitance: 100nF  [CAPC100x50x50L25]  (hidden comment: GCM155L8EH104KE07D)
C66  Voltage Rating: 16V  Capacitance: 1µF  [CAPC160X80X90L35]  (hidden comment: GCG188L8EE105KA07D)
FB8  Imax: 1.5A  Impedance: 220  [BEADC160X80X95L40]  (hidden comment: BLM18KG221BH1D)
FB9  Imax: 1.5A  Impedance: 220  [BEADC160X80X95L40]  (hidden comment: BLM18KG221BH1D)
FB10  Imax: 1.5A  Impedance: 220  [BEADC160X80X95L40]  (hidden comment: BLM18KG221BH1D)
R95  Resistance: 5.1  [RESC100X50X40L25]  (hidden comment: RC0402FR-075R1L)
R96  Resistance: 47.5k  [RESC100X50X40L25]  (hidden comment: RC0402FR-0747K5L)
R97  Resistance: 47.5k  [RESC100X50X40L25]  (hidden comment: RC0402FR-0747K5L)
R98  Resistance: 47.5k  [RESC100X50X40L25]  (hidden comment: RC0402FR-0747K5L)
R99  Resistance: 22  [RESC100X50X40L25]  (hidden comment: RC0402FR-0722RL)
R100  Resistance: 22  [RESC100X50X40L25]  (hidden comment: RC0402FR-0722RL)
R101  Resistance: 22  [RESC100X50X40L25]  (hidden comment: RC0402FR-0722RL)
R102  Resistance: 22  [RESC100X50X40L25]  (hidden comment: RC0402FR-0722RL)
R103  Resistance: 47.5k  [RESC100X50X40L25]  (hidden comment: RC0402FR-0747K5L)
R104  Resistance: 0  [RESC160X80X55L30]  (hidden comment: RC0603FR-070RL)
R105  Resistance: 47.5k  [RESC100X50X40L25]  (hidden comment: RC0402FR-0747K5L)
R106  Resistance: 47.5k  [RESC100X50X40L25]  (hidden comment: RC0402FR-0747K5L)
R107  Resistance: 22  [RESC100X50X40L25]  (hidden comment: RC0402FR-0722RL)
R108  Resistance: 22  [RESC100X50X40L25]  (hidden comment: RC0402FR-0722RL)
R109  Resistance: 22  [RESC100X50X40L25]  (hidden comment: RC0402FR-0722RL)
R110  Resistance: 22  [RESC100X50X40L25]  (hidden comment: RC0402FR-0722RL)
R111  Resistance: 47.5k  [RESC100X50X40L25]  (hidden comment: RC0402FR-0747K5L)
R112  Resistance: 47.5k  [RESC100X50X40L25]  (hidden comment: RC0402FR-0747K5L)
R113  Resistance: 0  [RESC160X80X55L30]  (hidden comment: RC0603FR-070RL)
U13  SCA3100-D07-1  [SCA3100-D07-1]
U14  ADXL382-2BCCZ-RL7  [14-LGA (2.9x2.8)]

### Ports
+3V3 (in), ACCL~{_INT0} (out), ACCL~{_INT1} (out), GND (in), I2C_A_SCL (in), I2C_A_SDA (bidir), SPI_A_EN (in), SPI_A_MISO (out), SPI_A_MOSI (in), SPI_A_SCK (in)

### Nets
+3V3: FB8.1 FB9.2 FB10.2 ; port +3V3
AC1GND: C58.1 C59.1 C60.1 C61.1 R103.1 R104.1 U13.1(RESERVED) U13.2(RESERVED) U13.3(AVSS) U13.11(DVSS) U13.12(EGND)
AC2GND: C62.1 C63.1 C64.1 C65.1 C66.1 R111.1 R112.1 R113.1 U14.9(GND)
GND: R104.2 R113.2 ; port GND
VDD_ACC: C58.2 C59.2 C60.2 C61.2 R95.2 R96.2 R97.2 R98.2 U13.4(AVDD) U13.10(DVDD)
VDD_ACCEL: C62.2 C63.2 FB9.1 R105.2 R106.2 U14.11(VDDIO)
ACCL~{_INT0}: R109.1 ; port ACCL~{_INT0}
ACCL~{_INT1}: R110.1 ; port ACCL~{_INT1}
I2C_A_SCL: R107.1 ; port I2C_A_SCL
I2C_A_SDA: R108.1 ; port I2C_A_SDA
SPI_A_EN: R99.1 ; port SPI_A_EN
SPI_A_MISO: R101.1 ; port SPI_A_MISO
SPI_A_MOSI: R100.2 ; port SPI_A_MOSI
SPI_A_SCK: R102.2 ; port SPI_A_SCK
NetC64_2: C64.2 U14.8(V1P8)
NetC65_2: C65.2 C66.2 FB10.1 U14.10(VS)
NetFB8_2: FB8.2 R95.1
NetR96_1: R96.1 R99.2 U13.5(CSB)
NetR97_1: R97.1 R101.2 U13.6(MISO)
NetR98_1: R98.1 R102.1 U13.7(SCK)
NetR100_1: R100.1 R103.2 U13.8(MOSI)
NetR105_1: R105.1 R110.2 U14.7(INT1)
NetR106_1: R106.1 R109.2 U14.6(INT0)
NetR107_2: R107.2 U14.2(SCLK/SCL)
NetR108_2: R108.2 U14.3(SDI/SDA)
NetR111_2: R111.2 U14.4(SDO/ASEL0)
NetR112_2: R112.2 U14.5(CS#/ASEL1)

Not connected (* = marked no-connect by the designer): U13 9(RESERVED)*; U14 1(FSYNC)* 12(SOUT0)* 13(SOUT1/MCLK)* 14(BCLK)*

### Notes on the sheet
- ACCELEROMETERS
- (near U13) Supply voltage = +3.0V to +3.6V
  Supply current = 5 mA (Active mode)
  Measurement range = ±6 g
  Temperature range = -40 ... +125 °C
- SPI clock rate = 8 MHz (MAX)
- I2C Adress  0x1D (Datasheet page 36) <https://www.analog.com/media/en/technical-documentation/data-sheets/adxl382.pdf>
- Supply voltage =  +2.25V to +3.6V
  Supply current =  520 µA (High performance)
  Measurement range = ±60 g
  Temperature range = -40 ... +125 °C
- Title
- Size:
- A4
- Number:
- Revision:
- Date:
- Time:
- Sheet
- of

### Library data of the parts
C58 = CMP-001-1984-2: CAP CER 10UF 10V X8L 0805; Manufacturer: TDK Corporation; Tolerance: 10%; Op Temp min: -55°C; Op Temp max: 150°C; ComponentLink3Description: Digikey; Mounting Type: SM; Ratings: AEC-Q200; ComponentLink1Description: Datasheet; ComponentLink3URL: https://www.digikey.com/en/products/detail/tdk-corporation/CGA4J1X8L1A106K125AC/9991388; Lead Spacing: 0mm; MPN: CGA4J1X8L1A106K125AC; Size: 2.00mm x 1.25mm; Height max: 1.5mm; ComponentLink2URL: https://eu.mouser.com/ProductDetail/TDK/CGA4J1X8L1A106K125AC?qs=gZXFycFWdANzH%252B2UvJJjtQ%3D%3D; Package: 0805 (2012 Metric); ComponentLink2Description: Mouser; Dielectric: X8L; ComponentLink1URL: https://product.tdk.com/en/search/capacitor/ceramic/mlcc/info?part_no=CGA4J1X8L1A106K125AC
C59-C62 C64 C65 = CMP-001-1980-2: CAP CER 0.1UF 50V X8L 0402; Manufacturer: Murata Electronics; Op Temp max: 150°C; Op Temp min: -55°C; Tolerance: 10%; Height max: 550µm; ComponentLink3Description: Digikey; Mounting Type: SM; ComponentLink3URL: https://www.digikey.com/en/products/detail/murata-electronics/GCM155L8EH104KE07D/11618823; Package: 0402 (1005 Metric); Lead Spacing: 0mm; MPN: GCM155L8EH104KE07D; Size: 1.00mm x 0.50mm; Ratings: AEC-Q200; ComponentLink1URL: https://www.murata.com/en-us/products/productdetail?partno=GCM155L8EH104KE07%23; ComponentLink1Description: Datasheet; Dielectric: X8L; ComponentLink2Description: Mouser; ComponentLink2URL: https://eu.mouser.com/ProductDetail/Murata-Electronics/GCM155L8EH104KE07D?qs=1mbolxNpo8fQSHf0HYnZWw%3D%3D
C63 C66 = CMP-001-1982-2: CAP CER 1UF 16V X8L 0603; Manufacturer: Murata Electronics; Tolerance: 10%; Op Temp min: -55°C; Op Temp max: 150°C; ComponentLink3URL: https://www.digikey.com/en/products/detail/murata-electronics/GCG188L8EE105KA07D/10695125; Package: 0603 (1608 Metric); MPN: GCG188L8EE105KA07D; ComponentLink2URL: https://eu.mouser.com/ProductDetail/Murata-Electronics/GCG188L8EE105KA07D?qs=rrS6PyfT74dFMfTR80dVTA%3D%3D; Dielectric: X8L; Size: 1.60mm x 0.80mm; ComponentLink1Description: Datasheet; ComponentLink1URL: https://www.murata.com/en-us/products/productdetail?partno=GCG188L8EE105KA07%23; ComponentLink2Description: Mouser; Height max: 900µm; Mounting Type: SM; ComponentLink3Description: Digikey; Lead Spacing: 0mm; Ratings: AEC-Q200
FB8-FB10 = CMP-001-1981-1: FERRITE BEAD 220 OHM 0603 1LN; Manufacturer: Murata Electronics; DCR: 50m; Op Temp min: -55°C; Frequency: 100MHz; Op Temp max: 150°C; Number of Lines: 1; Mounting Type: SM; Size: 1.60mm x 0.80mm; ComponentLink2URL: https://eu.mouser.com/ProductDetail/Murata-Electronics/BLM18KG221BH1D?qs=sJ5gq5MLFXpgEHYBdWUtkQ%3D%3D; ComponentLink1Description: Datasheet; ComponentLink1URL: https://www.murata.com/en-us/products/productdata/8798137286686/QNFA9129.pdf; Lead Spacing: 0mm; Ratings: AEC-Q200; ComponentLink3Description: Digikey; ComponentLink3URL: https://www.digikey.com/en/products/detail/murata-electronics/BLM18KG221BH1D/6156000; Height max: 950µm; Package: 0603 (1608 Metric); ComponentLink2Description: Mouser; MPN: BLM18KG221BH1D
R95 = CMP-00125-8: RES 5.1 OHM 1% 1/16W 0402; Manufacturer: YAGEO; Power: 63mW; Temperature Coefficient: ±200ppm; Op Temp max: 155°C; Op Temp min: -55°C; ComponentLink3URL: https://www.digikey.com/en/products/detail/yageo/RC0402FR-075R1L/5917722; ComponentLink2Description: Mouser; ComponentLink2URL: https://eu.mouser.com/ProductDetail/YAGEO/RC0402FR-075R1L?qs=%2Fha2pyFaduhjtLcYvKXQ8B9EFTm6YmMloHxcmTFokS12j5yrT26S1A%3D%3D; Size: 1.00mm x 0.50mm; ComponentLink3Description: Digikey; Package: 0402 (1005 Metric); Ratings: -; Tolerance: 1%; MPN: RC0402FR-075R1L; ComponentLink1URL: https://www.yageo.com/upload/media/product/productsearch/datasheet/rchip/PYu-RC_Group_51_RoHS_L_12.pdf; Mounting Type: SM; Composition: Thick Film; Height max: 400µm; ComponentLink1Description: Datasheet
R96-R98 R103 R105 R106 R111 R112 = CMP-001-0277-7: RES 47.5K OHM 1% 1/16W 0402; Manufacturer: YAGEO; Op Temp min: -55°C; Power: 63mW; Temperature Coefficient: ±100ppm; Op Temp max: 155°C; ComponentLink1URL: https://www.yageo.com/upload/media/product/productsearch/datasheet/rchip/PYu-RC_Group_51_RoHS_L_12.pdf; ComponentLink1Description: Datasheet; MPN: RC0402FR-0747K5L; ComponentLink3Description: Digikey; ComponentLink2URL: https://eu.mouser.com/ProductDetail/YAGEO/RC0402FR-0747K5L?qs=V1yeUXFNrklfu86Rfgihxg%3D%3D; Mounting Type: SM; Tolerance: 1%; Package: 0402 (1005 Metric); Height max: 400µm; ComponentLink2Description: Mouser; ComponentLink3URL: https://www.digikey.com/en/products/detail/yageo/RC0402FR-0747K5L/726617; Size: 1.00mm x 0.50mm; Composition: Thick Film; Ratings: -
R99-R102 R107-R110 = CMP-001-0482-4: RES 22 OHM 1% 1/16W 0402; Manufacturer: YAGEO; Temperature Coefficient: ±100ppm; Op Temp max: 155°C; Op Temp min: -55°C; Power: 63mW; Ratings: -; ComponentLink3URL: https://www.digikey.com/en/products/detail/yageo/RC0402FR-0722RL/726562; ComponentLink2URL: https://eu.mouser.com/ProductDetail/YAGEO/RC0402FR-0722RL?qs=V1yeUXFNrkkRg6zf08ADKQ%3D%3D; MPN: RC0402FR-0722RL; ComponentLink1Description: Datasheet; ComponentLink3Description: Digikey; Tolerance: 1%; Size: 1.00mm x 0.50mm; ComponentLink1URL: https://www.yageo.com/upload/media/product/productsearch/datasheet/rchip/PYu-RC_Group_51_RoHS_L_12.pdf; Composition: Thick Film; ComponentLink2Description: Mouser; Mounting Type: SM; Package: 0402 (1005 Metric); Height max: 400µm
R104 R113 = CMP-001-0927-2: RES 0 OHM JUMPER 1/10W 0603; Manufacturer: YAGEO; Op Temp min: -55°C; Op Temp max: 155°C; Power: 100mW; Tolerance: 0%; Height max: 550µm; ComponentLink2URL: https://eu.mouser.com/ProductDetail/YAGEO/RC0603FR-070RL?qs=0yPvnVz5%2FmpDQv43TwvCfw%3D%3D; Temperature Coefficient: -; ComponentLink3Description: Digikey; ComponentLink2Description: Mouser; MPN: RC0603FR-070RL; ComponentLink1URL: https://www.yageo.com/upload/media/product/productsearch/datasheet/rchip/PYu-RC_Group_51_RoHS_L_12.pdf; Ratings: -; Size: 1.60mm x 0.80mm; Composition: Thick Film; Mounting Type: SM; ComponentLink3URL: https://www.digikey.com/en/products/detail/yageo/RC0603FR-070RL/1304008; Package: 0603 (1608 Metric); ComponentLink1Description: Datasheet
U13 = SCA3100-D07-1: ACCELEROMETER 6G SPI 12SMD; Manufacturer: Murata Electronics; MPN: SCA3100-D07-1
U14 = ADXL382-2BCCZ-RL7: Accelerometer X, Y, Z Axis ±15g, 30g, 60g 50Hz ~ 8kHz 14-LGA (2.9x2.8); Manufacturer: Analog Devices Inc.; MPN: ADXL382-2BCCZ-RL7